# Altium schematic sheet CLK_Mux.SchDoc: Selektor zegarów (part 1 of 2)
size A3; Organization: Altium Limited; Address1: L3, 12a Rodborough Rd; Address2: Frenchs Forest; Address3: NSW; Address4: Australia 2086
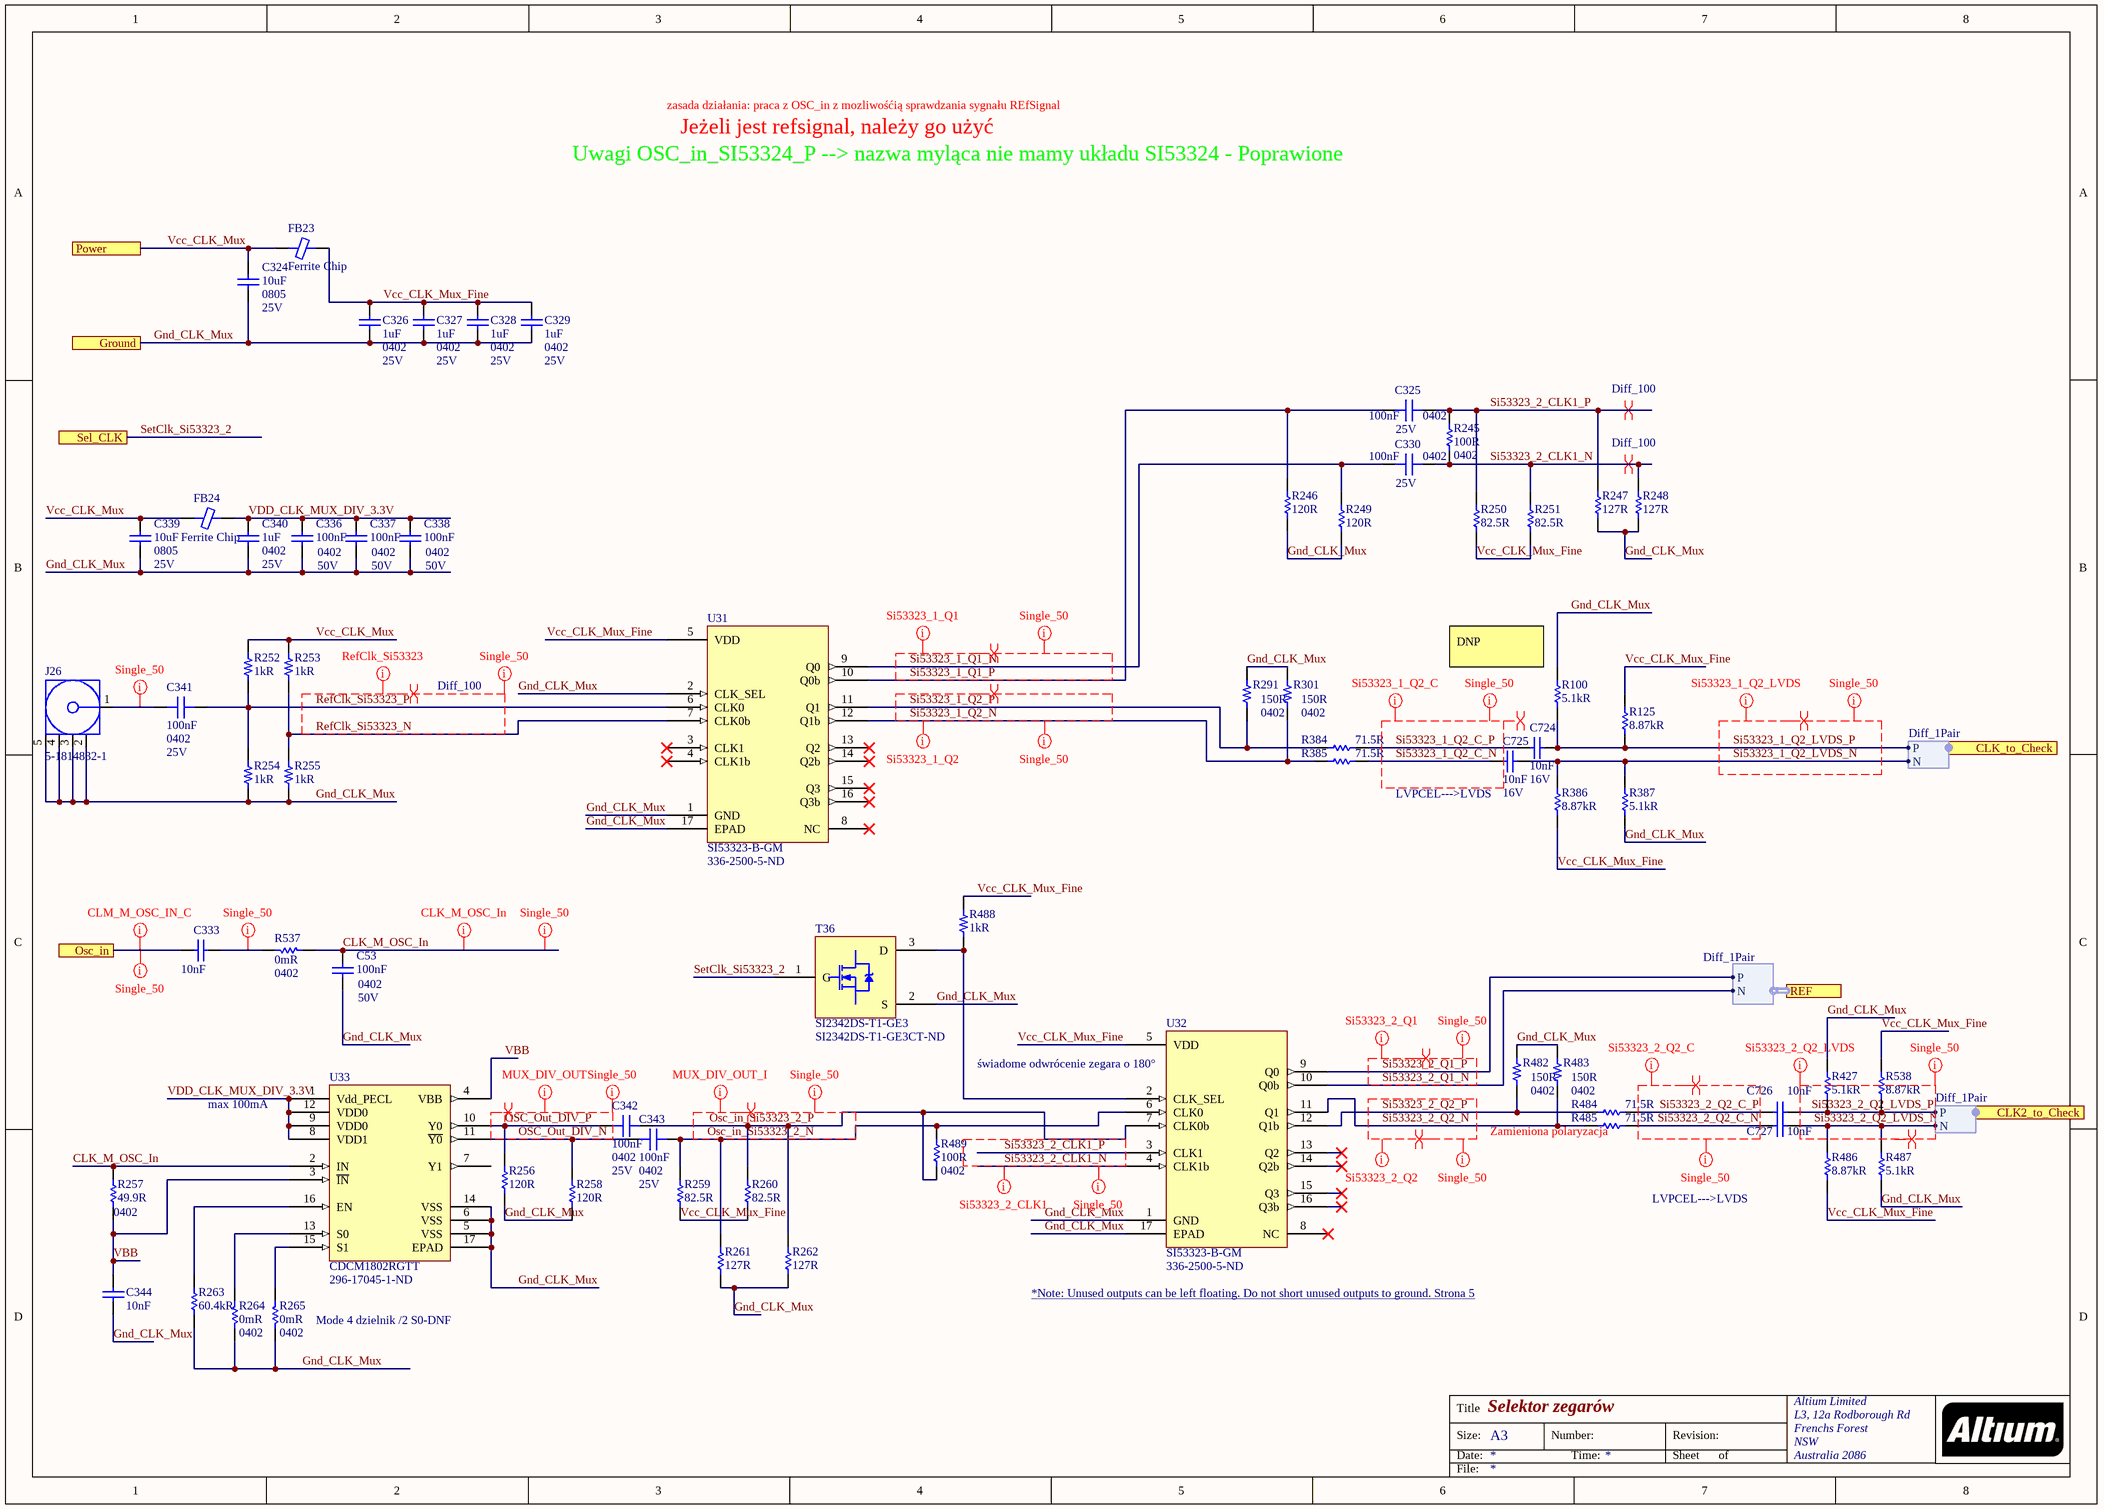
[diagram p0: CLK_Mux.SchDoc]

## Parts
C53  100nF  Case Code (Imperial): 0402  Voltage: 50V  [CAP 0402/1005 KK]
C324  10uF  Case/Package: 0805  Voltage Rating: 25V  [CAP 0805/2012 RF]
C325  100nF  Case/Package: 0402  Voltage Rating: 25V  [CAP 0402/1005 KK]
C326  1uF  Case/Package: 0402  Voltage Rating: 25V  [CAP 0402/1005 KK]
C327  1uF  Case/Package: 0402  Voltage Rating: 25V  [CAP 0402/1005 KK]
C328  1uF  Case/Package: 0402  Voltage Rating: 25V  [CAP 0402/1005 KK]
C329  1uF  Case/Package: 0402  Voltage Rating: 25V  [CAP 0402/1005 KK]
C330  100nF  Case/Package: 0402  Voltage Rating: 25V  [CAP 0402/1005 KK]
C333  10nF  [CAP 0201/0603 KK]
C336  100nF  Case Code (Imperial): 0402  Voltage: 50V  [CAP 0402/1005 KK]
C337  100nF  Case Code (Imperial): 0402  Voltage: 50V  [CAP 0402/1005 KK]
C338  100nF  Case Code (Imperial): 0402  Voltage: 50V  [CAP 0402/1005 KK]
C339  10uF  Case/Package: 0805  Voltage Rating: 25V  [CAP 0805/2012 RF]
C340  1uF  Case/Package: 0402  Voltage Rating: 25V  [CAP 0402/1005 KK]
C341  100nF  Case/Package: 0402  Voltage Rating: 25V  [CAP 0402/1005 KK]
C342  100nF  Case/Package: 0402  Voltage Rating: 25V  [CAP 0402/1005 KK]
C343  100nF  Case/Package: 0402  Voltage Rating: 25V  [CAP 0402/1005 KK]
C344  10nF  [CAP 0201/0603 KK]
C724  10nF  Voltage Rating (DC): 16V  [CAP 0201/0603 KK]
C725  10nF  Voltage Rating (DC): 16V  [CAP 0201/0603 KK]
C726  10nF  [CAP 0201/0603 KK]
C727  10nF  [CAP 0201/0603 KK]
FB23  Ferrite Chip  [FER 0603/1608]
FB24  Ferrite Chip  [FER 0603/1608]
J26  5-1814832-1  [TECO-5-1814832-1_V]
R100  5.1kR  [RES 0402/1005 RF KK]
R125  8.87kR  [RES 0402/1005 RF KK]
R245  100R  Case/Package: 0402  [RES 0402/1005 RF KK]
R246  120R  [RES 0402/1005 RF KK]
R247  127R  [RES 0402/1005 RF KK]
R248  127R  [RES 0402/1005 RF KK]
R249  120R  [RES 0402/1005 RF KK]
R250  82.5R  [RES 0402/1005 RF KK]
R251  82.5R  [RES 0402/1005 RF KK]
R252  1kR  [RES 0402/1005 RF KK]
R253  1kR  [RES 0402/1005 RF KK]
R254  1kR  [RES 0402/1005 RF KK]
R255  1kR  [RES 0402/1005 RF KK]
R256  120R  [RES 0402/1005 RF KK]
R257  49.9R  Case/Package: 0402  [RES 0402/1005 RF KK]
R258  120R  [RES 0402/1005 RF KK]
R259  82.5R  [RES 0402/1005 RF KK]
R260  82.5R  [RES 0402/1005 RF KK]
R261  127R  [RES 0402/1005 RF KK]
R262  127R  [RES 0402/1005 RF KK]
R263  60.4kR  [RES 0402/1005 RF KK]
R264  0mR  Case/Package: 0402  [RES 0402/1005 RF KK]
R265  0mR  Case/Package: 0402  [RES 0402/1005 RF KK]
R291  150R  Case/Package: 0402  [RES 0402/1005 RF KK]
R301  150R  Case/Package: 0402  [RES 0402/1005 RF KK]
R384  71.5R  [RES 0402/1005 RF KK]
R385  71.5R  [RES 0402/1005 RF KK]
R386  8.87kR  [RES 0402/1005 RF KK]
R387  5.1kR  [RES 0402/1005 RF KK]
R427  5.1kR  [RES 0402/1005 RF KK]
R482  150R  Case/Package: 0402  [RES 0402/1005 RF KK]
R483  150R  Case/Package: 0402  [RES 0402/1005 RF KK]
R484  71.5R  [RES 0402/1005 RF KK]
R485  71.5R  [RES 0402/1005 RF KK]
R486  8.87kR  [RES 0402/1005 RF KK]
R487  5.1kR  [RES 0402/1005 RF KK]
R488  1kR  [RES 0402/1005 RF KK]
R489  100R  Case/Package: 0402  [RES 0402/1005 RF KK]
R537  0mR  Case/Package: 0402  [RES 0402/1005 RF KK]
R538  8.87kR  [RES 0402/1005 RF KK]
T36  SI2342DS-T1-GE3  Supplier Part Number 1: SI2342DS-T1-GE3CT-ND  [SI2342DS-T1-GE3]
U31  SI53323-B-GM  Supplier Part Number 1: 336-2500-5-ND  [SI53323-B-GM]
U32  SI53323-B-GM  Supplier Part Number 1: 336-2500-5-ND  [SI53323-B-GM]
U33  CDCM1802RGTT  Supplier Part Number 1: 296-17045-1-ND  [CDCM1802RGTT]

## Ports
CLK2_to_Check (harness Diff_1Pair), CLK_to_Check (harness Diff_1Pair), Ground, Osc_in, Power, REF (harness Diff_1Pair), Sel_CLK

## Harnesses
Diff_1Pair: P, N
Diff_1Pair: N, P

## Nets
CLK_M_OSC_In: C53.2 R257.2 R537.1 U33.2(IN)
Gnd_CLK_Mux: C53.1 C324.1 C326.2 C327.2 C328.2 C329.2 C336.1 C337.1 C338.1 C339.1 C340.2 C344.1 J26.2 J26.3 J26.4 J26.5 R100.1 R246.1 R247.1 R248.1 R249.2 R254.1 R255.1 R256.1 R258.2 R261.1 R262.1 R263.1 R264.1 R265.1 R291.2 R301.2 R387.1 R427.1 R482.2 R483.2 R487.1 T36.2(S) U31.1(GND) U31.2(CLK_SEL) U31.17(EPAD) U32.1(GND) U32.17(EPAD) U33.5(VSS) U33.6(VSS) U33.14(VSS) U33.17(EPAD) ; port Ground
Osc_in: C333.1 ; port Osc_in
Osc_in_Si53323_2_N: C343.1 R259.2 R261.2 R489.2 U32.6(CLK0)
Osc_in_Si53323_2_P: C342.1 R260.2 R262.2 R489.1 U32.7(CLK0b)
OSC_Out_DIV_N: C343.2 R258.1 U33.11(~{Y0})
OSC_Out_DIV_P: C342.2 R256.2 U33.10(Y0)
RefClk_Si53323_N: R253.1 R255.2 U31.7(CLK0b)
RefClk_Si53323_P: C341.1 R252.1 R254.2 U31.6(CLK0)
SetClk_Si53323_2: T36.1(G) ; port Sel_CLK
Si53323_1_Q1_N: C330.2 R249.1 U31.9(Q0)
Si53323_1_Q1_P: C325.2 R246.2 U31.10(Q0b)
Si53323_1_Q2_C_N: C725.2 R385.1
Si53323_1_Q2_C_P: C724.2 R384.1
Si53323_1_Q2_LVDS_N: C725.1 R386.2 R387.2 ; port CLK_to_Check.N
Si53323_1_Q2_LVDS_P: C724.1 R100.2 R125.2 ; port CLK_to_Check.P
Si53323_1_Q2_N: R301.1 R385.2 U31.12(Q1b)
Si53323_1_Q2_P: R291.1 R384.2 U31.11(Q1)
Si53323_2_CLK1_N: C330.1 R245.1 R248.2 R251.2 U32.4(CLK1b)
Si53323_2_CLK1_P: C325.1 R245.2 R247.2 R250.2 U32.3(CLK1)
Si53323_2_Q1_N: U32.10(Q0b) ; port REF.N
Si53323_2_Q1_P: U32.9(Q0) ; port REF.P
Si53323_2_Q2_C_N: C727.2 R485.1
Si53323_2_Q2_C_P: C726.2 R484.1
Si53323_2_Q2_LVDS_N: C727.1 R486.2 R487.2 ; port CLK2_to_Check.N
Si53323_2_Q2_LVDS_P: C726.1 R427.2 R538.2 ; port CLK2_to_Check.P
Si53323_2_Q2_N: R483.1 R485.2 U32.11(Q1)
Si53323_2_Q2_P: R482.1 R484.2 U32.12(Q1b)
VBB: C344.2 R257.1 U33.3(~{IN}) U33.4(VBB)
Vcc_CLK_Mux: C324.2 C339.2 FB23.1 FB24.1 R252.2 R253.2 ; port Power
Vcc_CLK_Mux_Fine: C326.1 C327.1 C328.1 C329.1 FB23.2 R125.1 R250.1 R251.1 R259.1 R260.1 R386.1 R486.1 R488.2 R538.1 U31.5(VDD) U32.5(VDD)
VDD_CLK_MUX_DIV_3.3V: C336.2 C337.2 C338.2 C340.1 FB24.2 U33.1(Vdd_PECL) U33.8(VDD1) U33.9(VDD0) U33.12(VDD0)
NetC333_2: C333.2 R537.2
NetC341_2: C341.2 J26.1
NetR263_2: R263.2 U33.16(EN)
NetR264_2: R264.2 U33.13(S0)
NetR265_2: R265.2 U33.15(S1)
NetR488_1: R488.1 T36.3(D) U32.2(CLK_SEL)

Not connected (* = marked no-connect by the designer): U31 3(CLK1)* 4(CLK1b)* 8(NC)* 13(Q2)* 14(Q2b)* 15(Q3)* 16(Q3b)*; U32 8(NC)* 13(Q2)* 14(Q2b)* 15(Q3)* 16(Q3b)*; U33 7(Y1)

## Layout directives
differential pair; differential pair class Diff_100: Osc_in_Si53323_2_N, Osc_in_Si53323_2_P, OSC_Out_DIV_N, OSC_Out_DIV_P, RefClk_Si53323_N, RefClk_Si53323_P, Si53323_1_Q1_N, Si53323_1_Q1_P, Si53323_1_Q2_C_N, Si53323_1_Q2_C_P, Si53323_1_Q2_LVDS_N, Si53323_1_Q2_LVDS_P, Si53323_1_Q2_N, Si53323_1_Q2_P, Si53323_2_CLK1_N, Si53323_2_CLK1_P, Si53323_2_Q1_N, Si53323_2_Q1_P, Si53323_2_Q2_C_N, Si53323_2_Q2_C_P, Si53323_2_Q2_LVDS_N, Si53323_2_Q2_LVDS_P, Si53323_2_Q2_N, Si53323_2_Q2_P
net class MUX_DIV_OUT_I: Osc_in_Si53323_2_N, Osc_in_Si53323_2_P
net class CLM_M_OSC_IN_C: Osc_in
net class Si53323_2_Q1: Si53323_2_Q1_N, Si53323_2_Q1_P
net class Si53323_2_Q2: Si53323_2_Q2_N, Si53323_2_Q2_P
net class Si53323_1_Q1: Si53323_1_Q1_N, Si53323_1_Q1_P
net class Si53323_1_Q2: Si53323_1_Q2_N
net class CLK_M_OSC_In: CLK_M_OSC_In
net class Single_50: CLK_M_OSC_In, NetC333_2, NetC341_2, Osc_in, Osc_in_Si53323_2_N, Osc_in_Si53323_2_P, OSC_Out_DIV_N, OSC_Out_DIV_P, RefClk_Si53323_N, RefClk_Si53323_P, Si53323_1_Q1_N, Si53323_1_Q1_P, Si53323_1_Q2_C_N, Si53323_1_Q2_C_P, Si53323_1_Q2_LVDS_N, Si53323_1_Q2_LVDS_P, Si53323_1_Q2_N, Si53323_2_CLK1_N, Si53323_2_Q1_N, Si53323_2_Q1_P, Si53323_2_Q2_C_N, Si53323_2_Q2_C_P, Si53323_2_Q2_LVDS_N, Si53323_2_Q2_LVDS_P, Si53323_2_Q2_N, Si53323_2_Q2_P
net class MUX_DIV_OUT: OSC_Out_DIV_N, OSC_Out_DIV_P
net class Si53323_2_CLK1: Si53323_2_CLK1_N
net class RefClk_Si53323: RefClk_Si53323_N, RefClk_Si53323_P
net class Si53323_1_Q2_LVDS: Si53323_1_Q2_LVDS_N, Si53323_1_Q2_LVDS_P
net class Si53323_2_Q2_LVDS: Si53323_2_Q2_LVDS_N, Si53323_2_Q2_LVDS_P
net class Si53323_1_Q2_C: Si53323_1_Q2_C_N, Si53323_1_Q2_C_P
net class Si53323_2_Q2_C: Si53323_2_Q2_C_N, Si53323_2_Q2_C_P

## Notes on the sheet
- zasada działania: praca z OSC_in z mozliwośćią sprawdzania sygnału REfSignal
- Uwagi OSC_in_SI53324_P --> nazwa myląca nie mamy układu SI53324 - Poprawione
- Jeżeli jest refsignal, należy go użyć
- (near R100) DNP
- LVPCEL--->LVDS
- max 100mA
- (near U32) świadome odwrócenie zegara o 180°
- (near R485) Zamieniona polaryzacja
- (near R265) Mode 4 dzielnik /2 S0-DNF
- *Note: Unused outputs can be left floating. Do not short unused outputs to ground. Strona 5 <https://datasheet.ciiva.com/24019/si53323-258666-24019274.pdf?src-supplier=Mouser>
- Title
- Size:
- Date:
- A3
- Number:
- Time:
- Revision:
- Sheet
- of
- File: